# Altium schematic sheet cell_filter.SchDoc
size A0
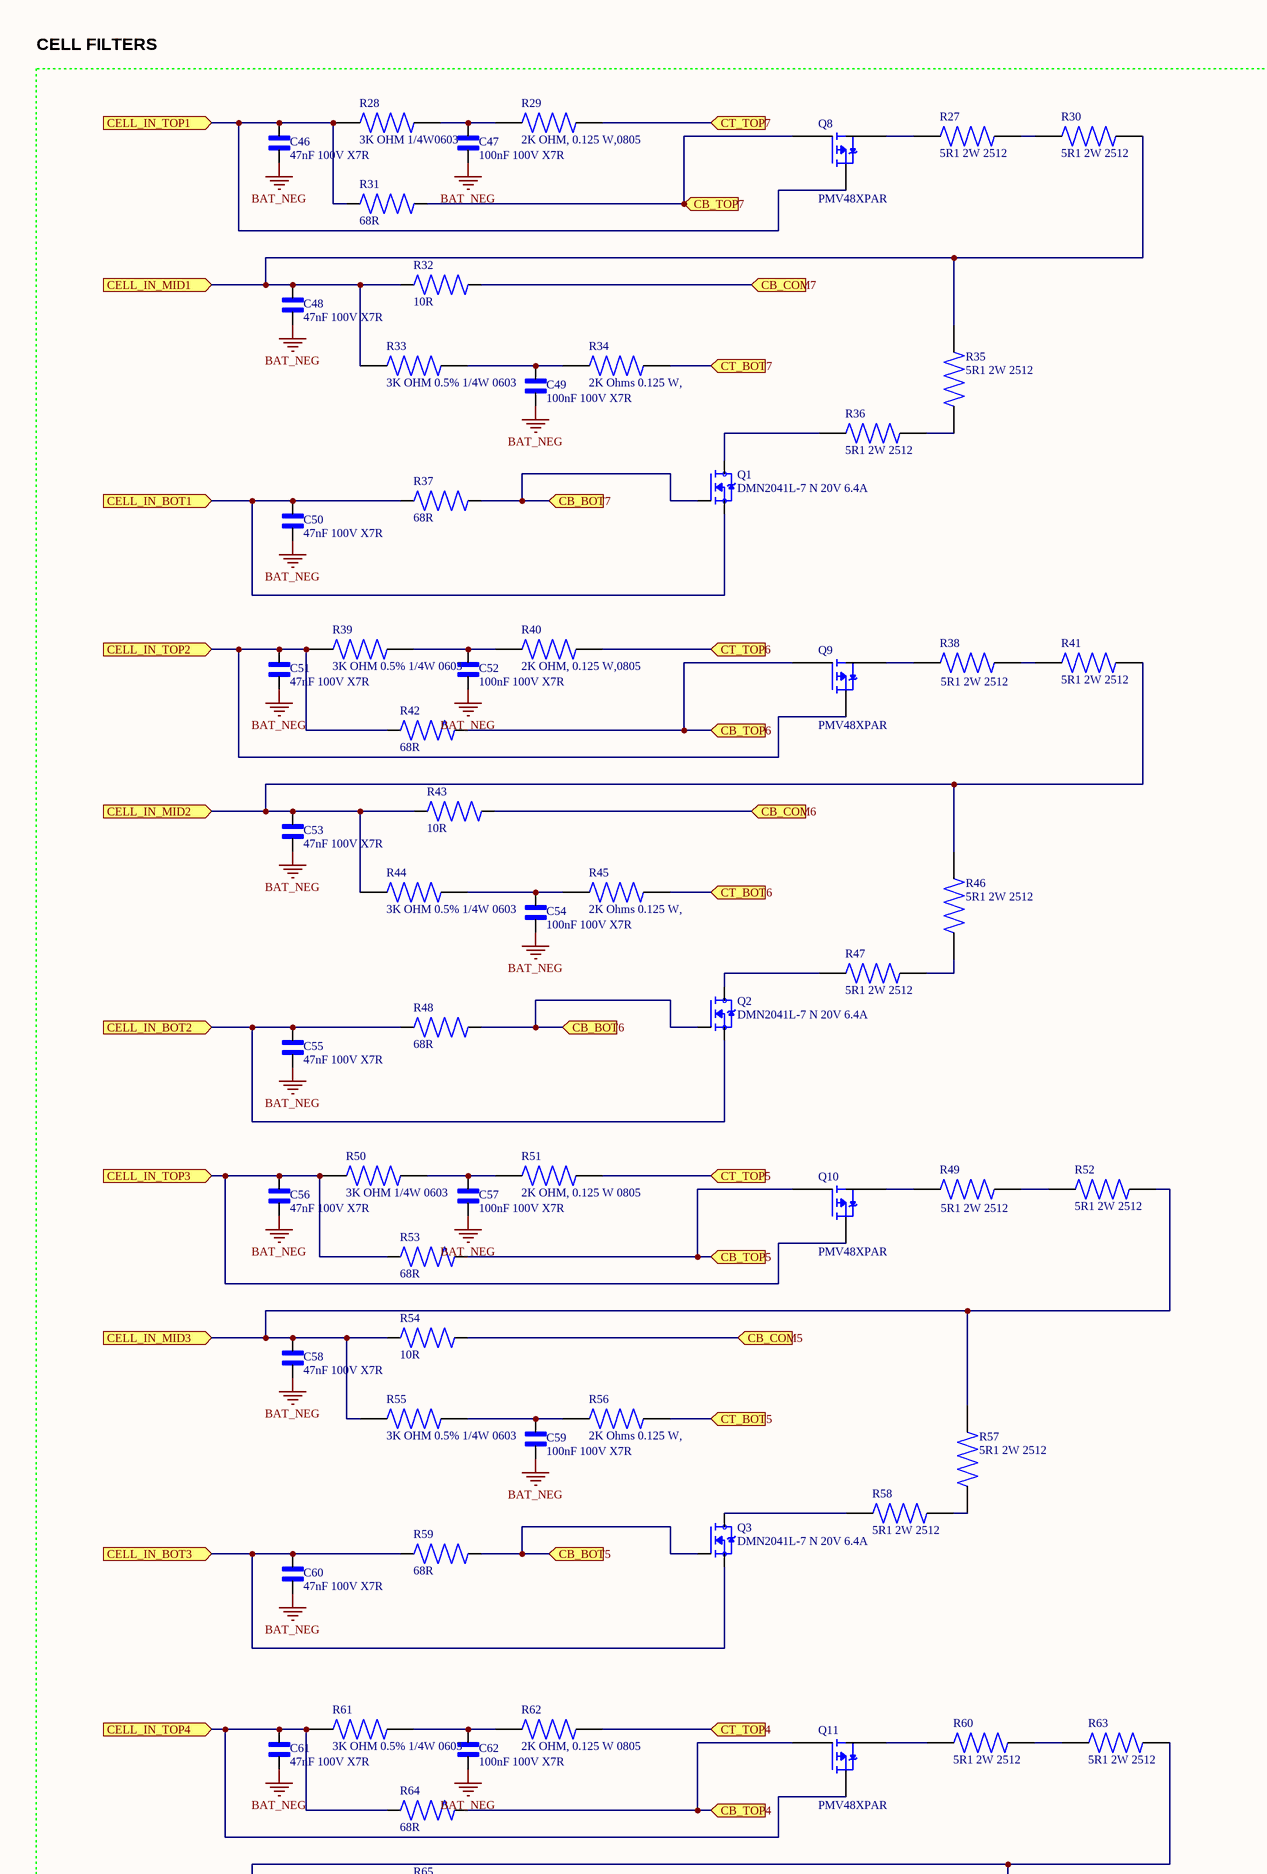
[diagram p0: cell_filter.SchDoc, top]
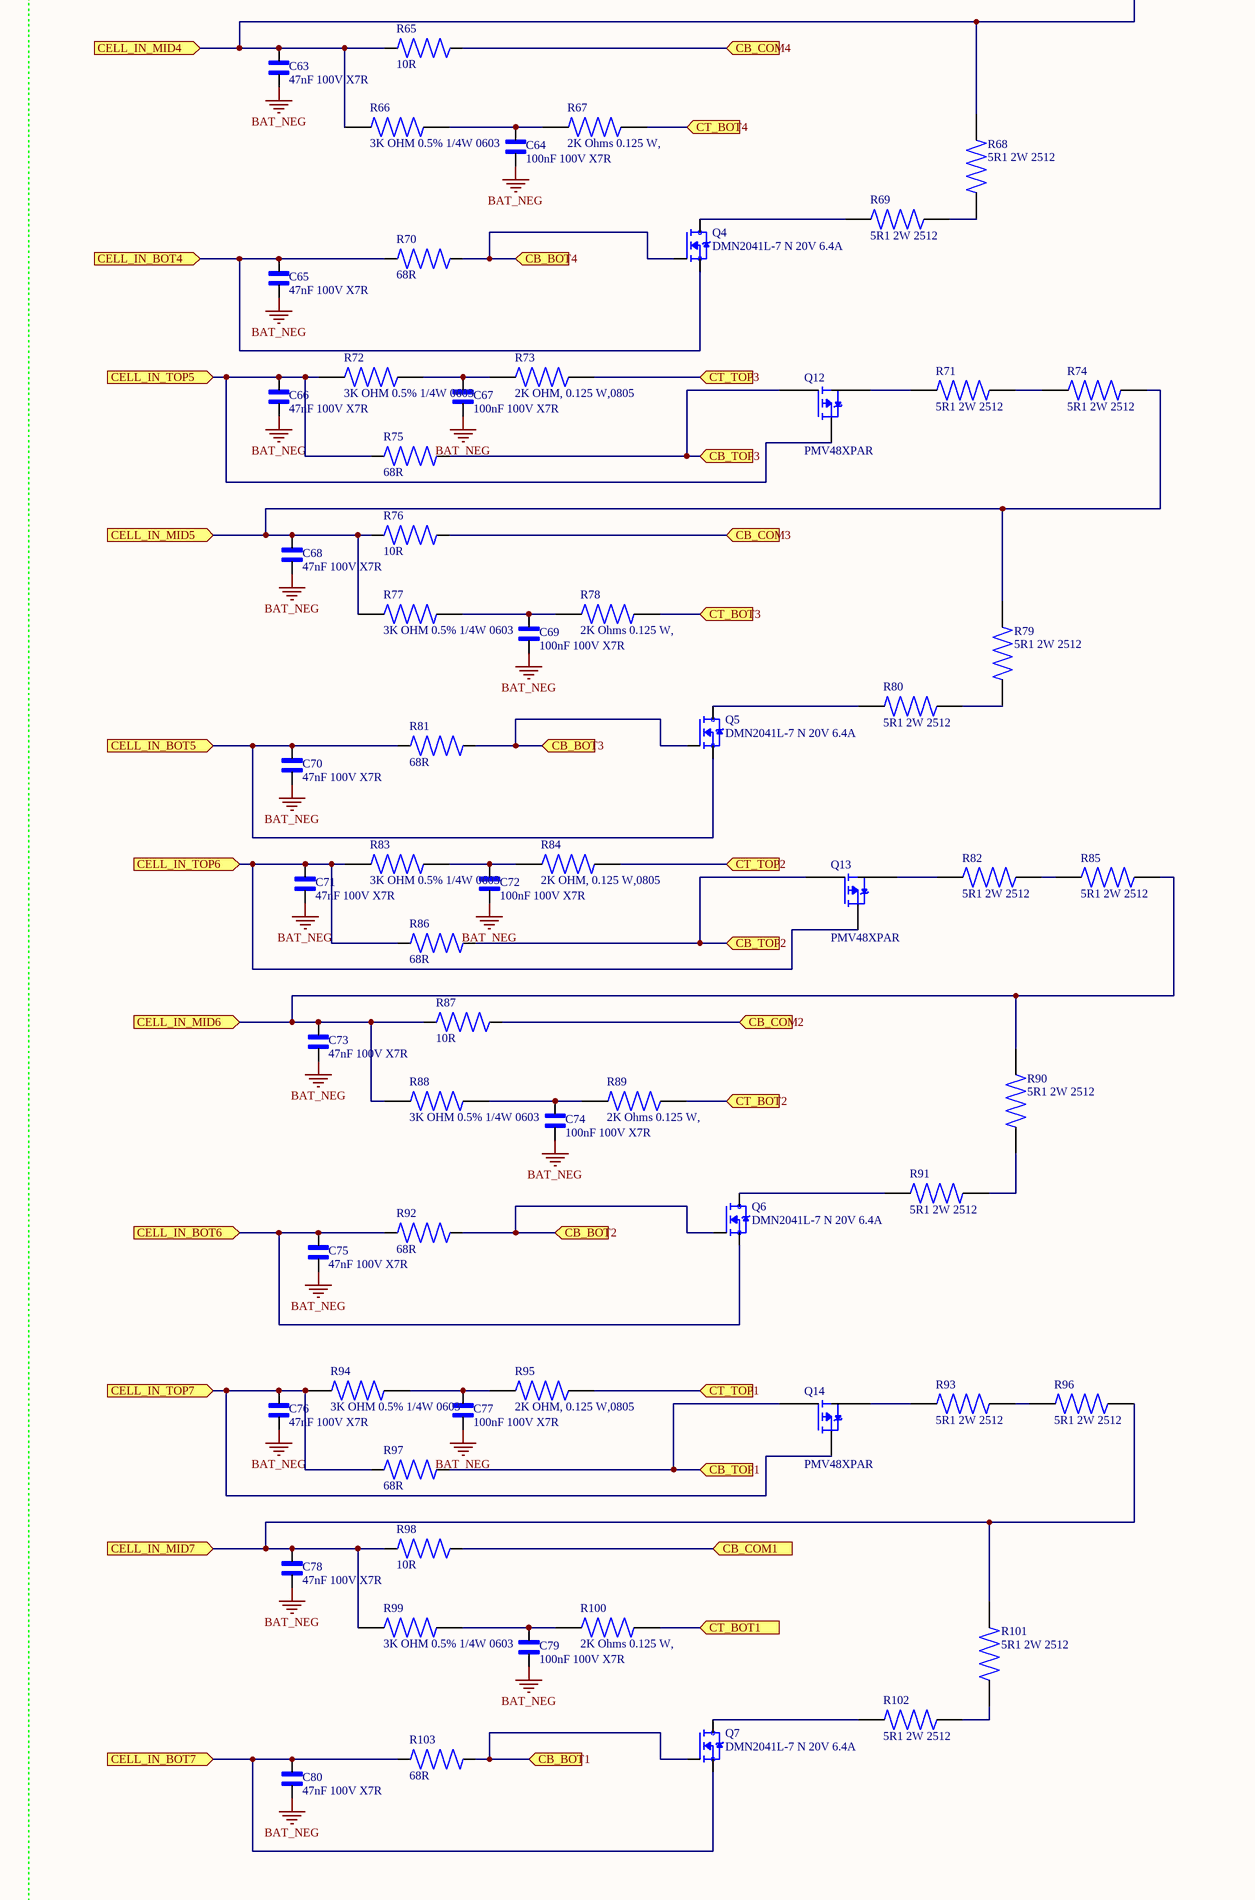
[diagram p1: cell_filter.SchDoc, bottom]

## Parts
C46  47nF 100V X7R  [CAPC2012X135N]
C47  100nF 100V X7R  [CAPC2012X135N]
C48  47nF 100V X7R  [CAPC2012X135N]
C49  100nF 100V X7R  [CAPC2012X135N]
C50  47nF 100V X7R  [CAPC2012X135N]
C51  47nF 100V X7R  [CAPC2012X135N]
C52  100nF 100V X7R  [CAPC2012X135N]
C53  47nF 100V X7R  [CAPC2012X135N]
C54  100nF 100V X7R  [CAPC2012X135N]
C55  47nF 100V X7R  [CAPC2012X135N]
C56  47nF 100V X7R  [CAPC2012X135N]
C57  100nF 100V X7R  [CAPC2012X135N]
C58  47nF 100V X7R  [CAPC2012X135N]
C59  100nF 100V X7R  [CAPC2012X135N]
C60  47nF 100V X7R  [CAPC2012X135N]
C61  47nF 100V X7R  [CAPC2012X135N]
C62  100nF 100V X7R  [CAPC2012X135N]
C63  47nF 100V X7R  [CAPC2012X135N]
C64  100nF 100V X7R  [CAPC2012X135N]
C65  47nF 100V X7R  [CAPC2012X135N]
C66  47nF 100V X7R  [CAPC2012X135N]
C67  100nF 100V X7R  [CAPC2012X135N]
C68  47nF 100V X7R  [CAPC2012X135N]
C69  100nF 100V X7R  [CAPC2012X135N]
C70  47nF 100V X7R  [CAPC2012X135N]
C71  47nF 100V X7R  [CAPC2012X135N]
C72  100nF 100V X7R  [CAPC2012X135N]
C73  47nF 100V X7R  [CAPC2012X135N]
C74  100nF 100V X7R  [CAPC2012X135N]
C75  47nF 100V X7R  [CAPC2012X135N]
C76  47nF 100V X7R  [CAPC2012X135N]
C77  100nF 100V X7R  [CAPC2012X135N]
C78  47nF 100V X7R  [CAPC2012X135N]
C79  100nF 100V X7R  [CAPC2012X135N]
C80  47nF 100V X7R  [CAPC2012X135N]
Q1  DMN2041L-7 N 20V 6.4A  [SOT91P240X110-3N]
Q2  DMN2041L-7 N 20V 6.4A  [SOT91P240X110-3N]
Q3  DMN2041L-7 N 20V 6.4A  [SOT91P240X110-3N]
Q4  DMN2041L-7 N 20V 6.4A  [SOT91P240X110-3N]
Q5  DMN2041L-7 N 20V 6.4A  [SOT91P240X110-3N]
Q6  DMN2041L-7 N 20V 6.4A  [SOT91P240X110-3N]
Q7  DMN2041L-7 N 20V 6.4A  [SOT91P240X110-3N]
Q8  PMV48XPAR  [SOT95P230X110-3N]
Q9  PMV48XPAR  [SOT95P230X110-3N]
Q10  PMV48XPAR  [SOT95P230X110-3N]
Q11  PMV48XPAR  [SOT95P230X110-3N]
Q12  PMV48XPAR  [SOT95P230X110-3N]
Q13  PMV48XPAR  [SOT95P230X110-3N]
Q14  PMV48XPAR  [SOT95P230X110-3N]
R27  5R1 2W 2512  [RESC6331X65N]
R28  3K OHM 1/4W0603  [RES_ERJPA3D3001V]
R29  2K OHM, 0.125 W,0805  [RESC2012X50N]
R30  5R1 2W 2512  [RESC6331X65N]
R31  68R  [RES1206]
R32  10R  [RESC2012X05N]
R33  3K OHM 0.5% 1/4W 0603  [RES_ERJPA3D3001V]
R34  2K Ohms 0.125 W,  [RESC2012X50N]
R35  5R1 2W 2512  [RESC6331X65N]
R36  5R1 2W 2512  [RESC6331X65N]
R37  68R  [RES1206]
R38  5R1 2W 2512  [RESC6331X65N]
R39  3K OHM 0.5% 1/4W 0603  [RES_ERJPA3D3001V]
R40  2K OHM, 0.125 W,0805  [RESC2012X50N]
R41  5R1 2W 2512  [RESC6331X65N]
R42  68R  [RES1206]
R43  10R  [RESC2012X05N]
R44  3K OHM 0.5% 1/4W 0603  [RES_ERJPA3D3001V]
R45  2K Ohms 0.125 W,  [RESC2012X50N]
R46  5R1 2W 2512  [RESC6331X65N]
R47  5R1 2W 2512  [RESC6331X65N]
R48  68R  [RES1206]
R49  5R1 2W 2512  [RESC6331X65N]
R50  3K OHM 1/4W 0603  [RES_ERJPA3D3001V]
R51  2K OHM, 0.125 W 0805  [RESC2012X50N]
R52  5R1 2W 2512  [RESC6331X65N]
R53  68R  [RES1206]
R54  10R  [RESC2012X05N]
R55  3K OHM 0.5% 1/4W 0603  [RES_ERJPA3D3001V]
R56  2K Ohms 0.125 W,  [RESC2012X50N]
R57  5R1 2W 2512  [RESC6331X65N]
R58  5R1 2W 2512  [RESC6331X65N]
R59  68R  [RES1206]
R60  5R1 2W 2512  [RESC6331X65N]
R61  3K OHM 0.5% 1/4W 0603  [RES_ERJPA3D3001V]
R62  2K OHM, 0.125 W 0805  [RESC2012X50N]
R63  5R1 2W 2512  [RESC6331X65N]
R64  68R  [RES1206]
R65  10R  [RESC2012X05N]
R66  3K OHM 0.5% 1/4W 0603  [RES_ERJPA3D3001V]
R67  2K Ohms 0.125 W,  [RESC2012X50N]
R68  5R1 2W 2512  [RESC6331X65N]
R69  5R1 2W 2512  [RESC6331X65N]
R70  68R  [RES1206]
R71  5R1 2W 2512  [RESC6331X65N]
R72  3K OHM 0.5% 1/4W 0603  [RES_ERJPA3D3001V]
R73  2K OHM, 0.125 W,0805  [RESC2012X50N]
R74  5R1 2W 2512  [RESC6331X65N]
R75  68R  [RES1206]
R76  10R  [RESC2012X05N]
R77  3K OHM 0.5% 1/4W 0603  [RES_ERJPA3D3001V]
R78  2K Ohms 0.125 W,  [RESC2012X50N]
R79  5R1 2W 2512  [RESC6331X65N]
R80  5R1 2W 2512  [RESC6331X65N]
R81  68R  [RES1206]
R82  5R1 2W 2512  [RESC6331X65N]
R83  3K OHM 0.5% 1/4W 0603  [RES_ERJPA3D3001V]
R84  2K OHM, 0.125 W,0805  [RESC2012X50N]
R85  5R1 2W 2512  [RESC6331X65N]
R86  68R  [RES1206]
R87  10R  [RESC2012X05N]
R88  3K OHM 0.5% 1/4W 0603  [RES_ERJPA3D3001V]
R89  2K Ohms 0.125 W,  [RESC2012X50N]
R90  5R1 2W 2512  [RESC6331X65N]
R91  5R1 2W 2512  [RESC6331X65N]
R92  68R  [RES1206]
R93  5R1 2W 2512  [RESC6331X65N]
R94  3K OHM 0.5% 1/4W 0603  [RES_ERJPA3D3001V]
R95  2K OHM, 0.125 W,0805  [RESC2012X50N]
R96  5R1 2W 2512  [RESC6331X65N]
R97  68R  [RES1206]
R98  10R  [RESC2012X05N]
R99  3K OHM 0.5% 1/4W 0603  [RES_ERJPA3D3001V]
R100  2K Ohms 0.125 W,  [RESC2012X50N]
R101  5R1 2W 2512  [RESC6331X65N]
R102  5R1 2W 2512  [RESC6331X65N]
R103  68R  [RES1206]

## Blocks framed on the sheet
CELL FILTERS: C46-C80 Q1-Q14 R27-R103

## Ports
CB_BOT1 (in), CB_BOT2 (in), CB_BOT3 (in), CB_BOT4 (in), CB_BOT5 (in), CB_BOT6 (in), CB_BOT7 (in), CB_COM1 (in), CB_COM2 (in), CB_COM3 (in), CB_COM4 (in), CB_COM5 (in), CB_COM6 (in), CB_COM7 (in), CB_TOP1 (in), CB_TOP2 (in), CB_TOP3 (in), CB_TOP4 (in), CB_TOP5 (in), CB_TOP6 (in), CB_TOP7 (in), CELL_IN_BOT1 (in), CELL_IN_BOT2 (in), CELL_IN_BOT3 (in), CELL_IN_BOT4 (in), CELL_IN_BOT5 (in), CELL_IN_BOT6 (in), CELL_IN_BOT7 (in), CELL_IN_MID1 (in), CELL_IN_MID2 (in), CELL_IN_MID3 (in), CELL_IN_MID4 (in), CELL_IN_MID5 (in), CELL_IN_MID6 (in), CELL_IN_MID7 (in), CELL_IN_TOP1 (in), CELL_IN_TOP2 (in), CELL_IN_TOP3 (in), CELL_IN_TOP4 (in), CELL_IN_TOP5 (in), CELL_IN_TOP6 (in), CELL_IN_TOP7 (in), CT_BOT1 (in), CT_BOT2 (in), CT_BOT3 (in), CT_BOT4 (in), CT_BOT5 (in), CT_BOT6 (in), CT_BOT7 (in), CT_TOP1 (in), CT_TOP2 (in), CT_TOP3 (in), CT_TOP4 (in), CT_TOP5 (in), CT_TOP6 (in), CT_TOP7 (in)

## Nets
BAT_NEG: C46.2 C47.1 C48.2 C49.1 C50.2 C51.2 C52.1 C53.2 C54.1 C55.2 C56.2 C57.1 C58.2 C59.1 C60.2 C61.2 C62.1 C63.2 C64.1 C65.2 C66.2 C67.1 C68.2 C69.1 C70.2 C71.2 C72.1 C73.2 C74.1 C75.2 C76.2 C77.1 C78.2 C79.1 C80.2
CB_BOT1: Q7.1(G) R103.2 ; port CB_BOT1
CB_BOT2: Q6.1(G) R92.2 ; port CB_BOT2
CB_BOT3: Q5.1(G) R81.2 ; port CB_BOT3
CB_BOT4: Q4.1(G) R70.2 ; port CB_BOT4
CB_BOT5: Q3.1(G) R59.2 ; port CB_BOT5
CB_BOT6: Q2.1(G) R48.2 ; port CB_BOT6
CB_BOT7: Q1.1(G) R37.2 ; port CB_BOT7
CB_COM1: R98.2 ; port CB_COM1
CB_COM2: R87.2 ; port CB_COM2
CB_COM3: R76.2 ; port CB_COM3
CB_COM4: R65.2 ; port CB_COM4
CB_COM5: R54.2 ; port CB_COM5
CB_COM6: R43.2 ; port CB_COM6
CB_COM7: R32.2 ; port CB_COM7
CB_TOP1: Q14.1(G) R97.2 ; port CB_TOP1
CB_TOP2: Q13.1(G) R86.2 ; port CB_TOP2
CB_TOP3: Q12.1(G) R75.2 ; port CB_TOP3
CB_TOP4: Q11.1(G) R64.2 ; port CB_TOP4
CB_TOP5: Q10.1(G) R53.2 ; port CB_TOP5
CB_TOP6: Q9.1(G) R42.2 ; port CB_TOP6
CB_TOP7: Q8.1(G) R31.2 ; port CB_TOP7
CELL_IN_BOT1: C50.1 Q1.2(S) R37.1 ; port CELL_IN_BOT1
CELL_IN_BOT2: C55.1 Q2.2(S) R48.1 ; port CELL_IN_BOT2
CELL_IN_BOT3: C60.1 Q3.2(S) R59.1 ; port CELL_IN_BOT3
CELL_IN_BOT4: C65.1 Q4.2(S) R70.1 ; port CELL_IN_BOT4
CELL_IN_BOT5: C70.1 Q5.2(S) R81.1 ; port CELL_IN_BOT5
CELL_IN_BOT6: C75.1 Q6.2(S) R92.1 ; port CELL_IN_BOT6
CELL_IN_BOT7: C80.1 Q7.2(S) R103.1 ; port CELL_IN_BOT7
CELL_IN_MID1: C48.1 R30.2 R32.1 R33.1 R35.1 ; port CELL_IN_MID1
CELL_IN_MID2: C53.1 R41.1 R43.1 R44.1 R46.1 ; port CELL_IN_MID2
CELL_IN_MID3: C58.1 R52.1 R54.1 R55.1 R57.1 ; port CELL_IN_MID3
CELL_IN_MID4: C63.1 R63.1 R65.1 R66.1 R68.1 ; port CELL_IN_MID4
CELL_IN_MID5: C68.1 R74.1 R76.1 R77.1 R79.1 ; port CELL_IN_MID5
CELL_IN_MID6: C73.1 R85.1 R87.1 R88.1 R90.1 ; port CELL_IN_MID6
CELL_IN_MID7: C78.1 R96.1 R98.1 R99.1 R101.1 ; port CELL_IN_MID7
CELL_IN_TOP1: C46.1 Q8.2(S) R28.1 R31.1 ; port CELL_IN_TOP1
CELL_IN_TOP2: C51.1 Q9.2(S) R39.1 R42.1 ; port CELL_IN_TOP2
CELL_IN_TOP3: C56.1 Q10.2(S) R50.1 R53.1 ; port CELL_IN_TOP3
CELL_IN_TOP4: C61.1 Q11.2(S) R61.1 R64.1 ; port CELL_IN_TOP4
CELL_IN_TOP5: C66.1 Q12.2(S) R72.1 R75.1 ; port CELL_IN_TOP5
CELL_IN_TOP6: C71.1 Q13.2(S) R83.1 R86.1 ; port CELL_IN_TOP6
CELL_IN_TOP7: C76.1 Q14.2(S) R94.1 R97.1 ; port CELL_IN_TOP7
CT_BOT1: R100.2 ; port CT_BOT1
CT_BOT2: R89.2 ; port CT_BOT2
CT_BOT3: R78.2 ; port CT_BOT3
CT_BOT4: R67.2 ; port CT_BOT4
CT_BOT5: R56.2 ; port CT_BOT5
CT_BOT6: R45.2 ; port CT_BOT6
CT_BOT7: R34.2 ; port CT_BOT7
CT_TOP1: R95.2 ; port CT_TOP1
CT_TOP2: R84.2 ; port CT_TOP2
CT_TOP3: R73.2 ; port CT_TOP3
CT_TOP4: R62.2 ; port CT_TOP4
CT_TOP5: R51.2 ; port CT_TOP5
CT_TOP6: R40.2 ; port CT_TOP6
CT_TOP7: R29.2 ; port CT_TOP7
NetC47_2: C47.2 R28.2 R29.1
NetC49_2: C49.2 R33.2 R34.1
NetC52_2: C52.2 R39.2 R40.1
NetC54_2: C54.2 R44.2 R45.1
NetC57_2: C57.2 R50.2 R51.1
NetC59_2: C59.2 R55.2 R56.1
NetC62_2: C62.2 R61.2 R62.1
NetC64_2: C64.2 R66.2 R67.1
NetC67_2: C67.2 R72.2 R73.1
NetC69_2: C69.2 R77.2 R78.1
NetC72_2: C72.2 R83.2 R84.1
NetC74_2: C74.2 R88.2 R89.1
NetC77_2: C77.2 R94.2 R95.1
NetC79_2: C79.2 R99.2 R100.1
NetQ1_3: Q1.3(D) R36.2
NetQ2_3: Q2.3(D) R47.2
NetQ3_3: Q3.3(D) R58.2
NetQ4_3: Q4.3(D) R69.2
NetQ5_3: Q5.3(D) R80.2
NetQ6_3: Q6.3(D) R91.2
NetQ7_3: Q7.3(D) R102.2
NetQ8_3: Q8.3(D) R27.2
NetQ9_3: Q9.3(D) R38.2
NetQ10_3: Q10.3(D) R49.2
NetQ11_3: Q11.3(D) R60.2
NetQ12_3: Q12.3(D) R71.2
NetQ13_3: Q13.3(D) R82.2
NetQ14_3: Q14.3(D) R93.2
NetR27_1: R27.1 R30.1
NetR35_2: R35.2 R36.1
NetR38_1: R38.1 R41.2
NetR46_2: R46.2 R47.1
NetR49_1: R49.1 R52.2
NetR57_2: R57.2 R58.1
NetR60_1: R60.1 R63.2
NetR68_2: R68.2 R69.1
NetR71_1: R71.1 R74.2
NetR79_2: R79.2 R80.1
NetR82_1: R82.1 R85.2
NetR90_2: R90.2 R91.1
NetR93_1: R93.1 R96.2
NetR101_2: R101.2 R102.1

## Library data of the parts
C46 C48 C50 C51 C53 C55 C56 C58 C60 C61 C63 C65 C66 C68 C70 C71 C73 C75 C76 C78 C80 = GRM21BR71H473KA01L: SMD Capacitor X7R(EIA) with Capacitance: 47000pF Tol. 10%. Rated Voltage: 100Vdc; MF: Yageo; MP: CC0805KKX7R0BB473; Package: yageo; Value: *; Check_prices: https://www.snapeda.com/parts/GRM21BR71H473KA01L/Murata/view-part/?ref=eda
C47 C49 C52 C54 C57 C59 C62 C64 C67 C69 C72 C74 C77 C79 = GRM21BR71H104KA01L: Seramik, X7R, 100V, 0805 Kılıf0.1 µF / 100 nF; MF: Yageo; MP: CC0805KKX7R0BB104; SnapEDA_Link: https://www.snapeda.com/parts/GRM21BR71H104KA01L/Murata/view-part/?ref=snap; Package: 805-2 Murata; Value: *; Check_prices: https://www.snapeda.com/parts/GRM21BR71H104KA01L/Murata/view-part/?ref=eda
Q1-Q7 = DMN2041L-7: MOSFET N-Channel 20V 6.4A SOT23 | Diodes Inc DMN2041L-7; MF: Diodes Inc.; SnapEDA_Link: https://www.snapeda.com/parts/DMN2041L-7/Diodes+Inc./view-part/?ref=snap; Package: SOT-23 Diodes Inc.; Value: *; MP: DMN2041L-7; Check_prices: https://www.snapeda.com/parts/DMN2041L-7/Diodes+Inc./view-part/?ref=eda
Q8-Q14 = PMV48XPAR: P-Channel 20 V 3.5A (Ta) 510mW (Ta), 4.15W (Tc) Surface Mount TO-236AB; MF: Nexperia USA; SnapEDA_Link: https://www.snapeda.com/parts/PMV48XPAR/Nexperia/view-part/?ref=snap; Package: SOT23-3 Nexperia USA Inc.; Value: *; MP: PMV48XPAR; Check_prices: https://www.snapeda.com/parts/PMV48XPAR/Nexperia/view-part/?ref=eda
R27 R30 R35 R36 R38 R41 R46 R47 R49 R52 R57 R58 R60 R63 R68 R69 R71 R74 R79 R80 R82 R85 R90 R91 R93 R96 R101 R102 = SR2512JK-7W10RL: 521 2W 2512; MF: {'manufacturer': u'YAGEO'}; MP: RC2512JK-7W5R1L; Package: None; Price: None; Value: *; Availability: Unavailable
R28 R33 R39 R44 R50 R55 R61 R66 R72 R77 R83 R88 R94 R99 = ERJPA3D3001V: RES SMD 3K OHM 0.5% 1/4W 0603; MF: Panasonic; SnapEDA_Link: https://www.snapeda.com/parts/ERJPA3D3001V/Panasonic/view-part/?ref=snap; Package: 1608-2 Panasonic; Value: *; MP: ERJPA3D3001V; Check_prices: https://www.snapeda.com/parts/ERJPA3D3001V/Panasonic/view-part/?ref=eda
R29 R34 R40 R45 R51 R56 R62 R67 R73 R78 R84 R89 R95 R100 = CRCW08052K00FKEA: Resistor,Thick Film,Res 2 Kilohms,Pwr-Rtg 0.125 W,Tol 1%,SMT,0805,Tape & Reel | Vishay Dale CRCW08052K00FKEA; SnapEDA_Link: https://www.snapeda.com/parts/CRCW08052K00FKEA/Vishay+Dale/view-part/?ref=snap; Package: 2012 Vishay; Value: *; MF: Vishay Dale; MP: CRCW08052K00FKEA; Check_prices: https://www.snapeda.com/parts/CRCW08052K00FKEA/Vishay+Dale/view-part/?ref=eda
R31 R37 R42 R48 R53 R59 R64 R70 R75 R81 R86 R92 R97 R103 = gen_R_68R_2010: SMD Resistor 68R 1206; Tolerance: 1%; Power: 0.75W; Case EIA: 2010; Case Metric: 5025; Maximum Working Voltage: 200V; PnP Package: 2010R; Automotive Qualified: True; Part Number: gen_R_68R_2010; Operating Temperature: -55°C - +155°C; Resistance: 68R; Series: E24; PnP Value: 68R; Supplier 1: Farnell; Supplier Part Number 1: 2323988
R32 R43 R54 R65 R76 R87 R98 = gen_R_10R_0805: SMD Resistor 10R 0805; Tolerance: 1%; Power: 0.125W; Case EIA: 0805; Case Metric: 2012; Maximum Working Voltage: 150V; PnP Package: 0805R; Automotive Qualified: True; AEC-Q Norm: AEC-Q200; AEC-Q Grade: Grade 0; Part Number: gen_R_10R_0805; Operating Temperature: -55°C - +155°C; Resistance: 10R; Series: E24, E96; PnP Value: 10R; Supplier 1: Farnell; Supplier Part Number 1: 1750728; ECCN: EAR99